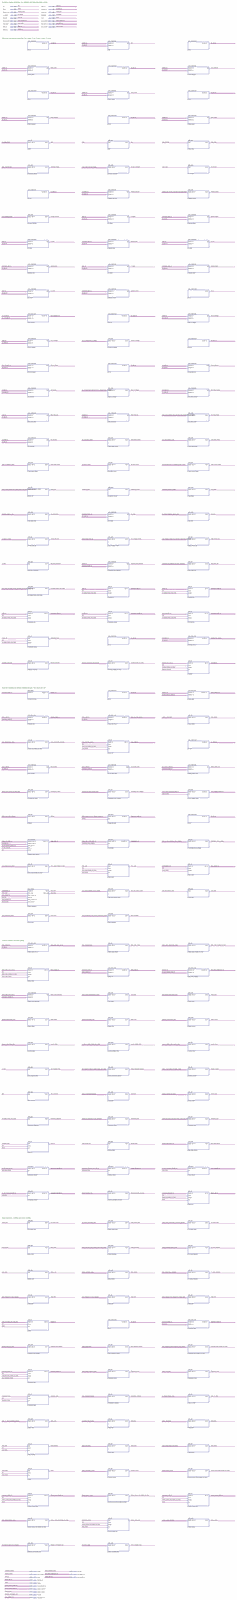
[diagram p0: schematic sheet, whole]
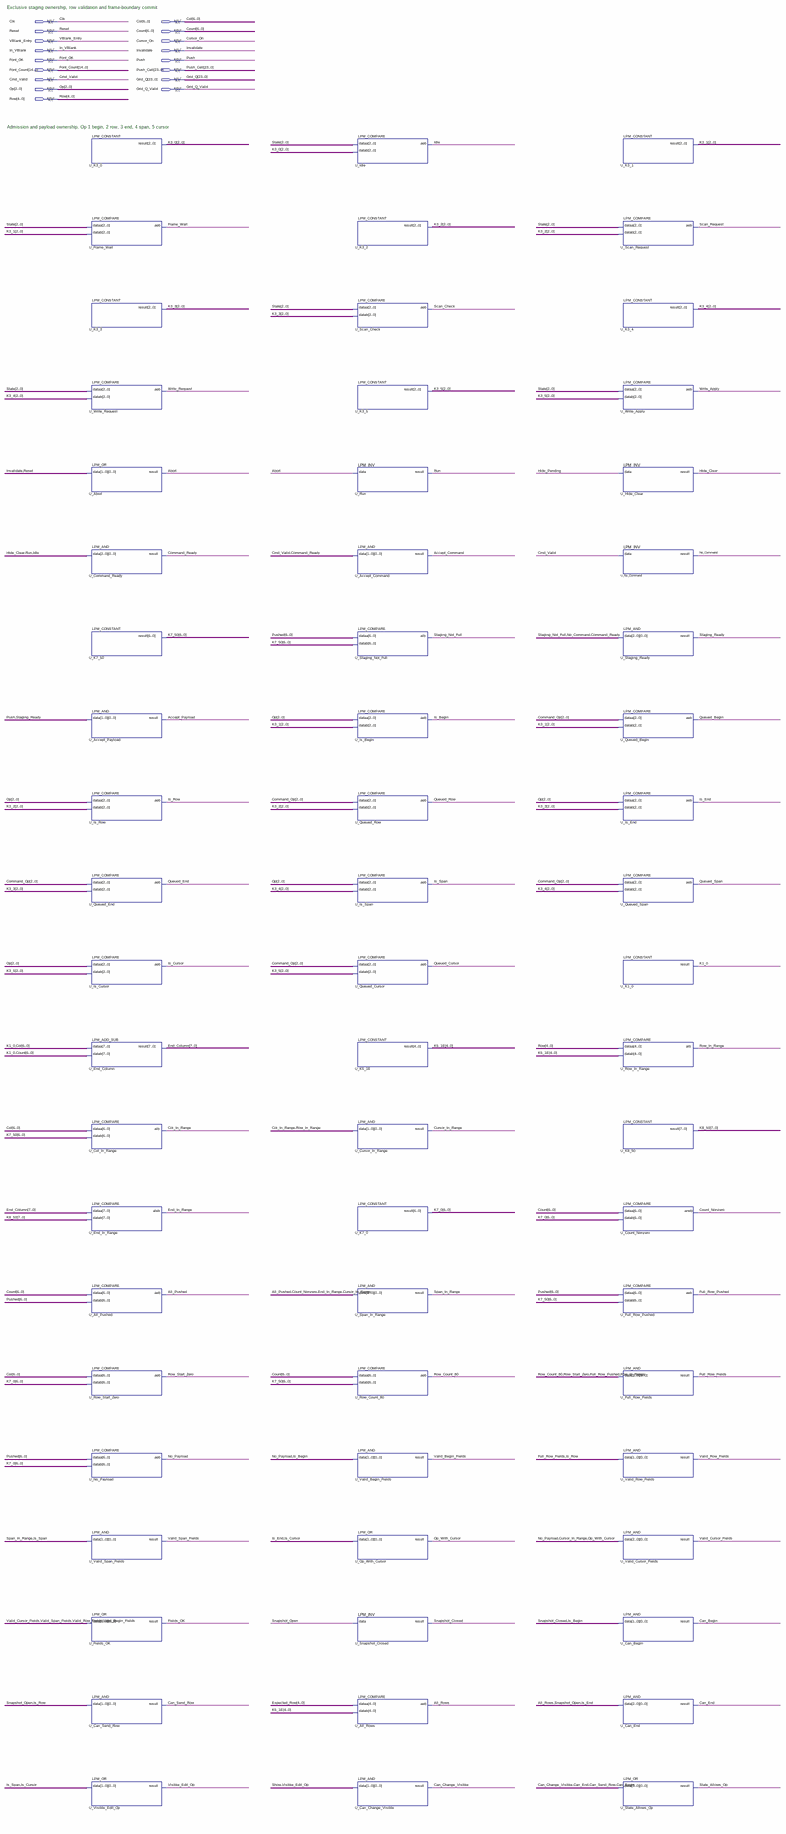
[diagram p1: schematic sheet, upper part]
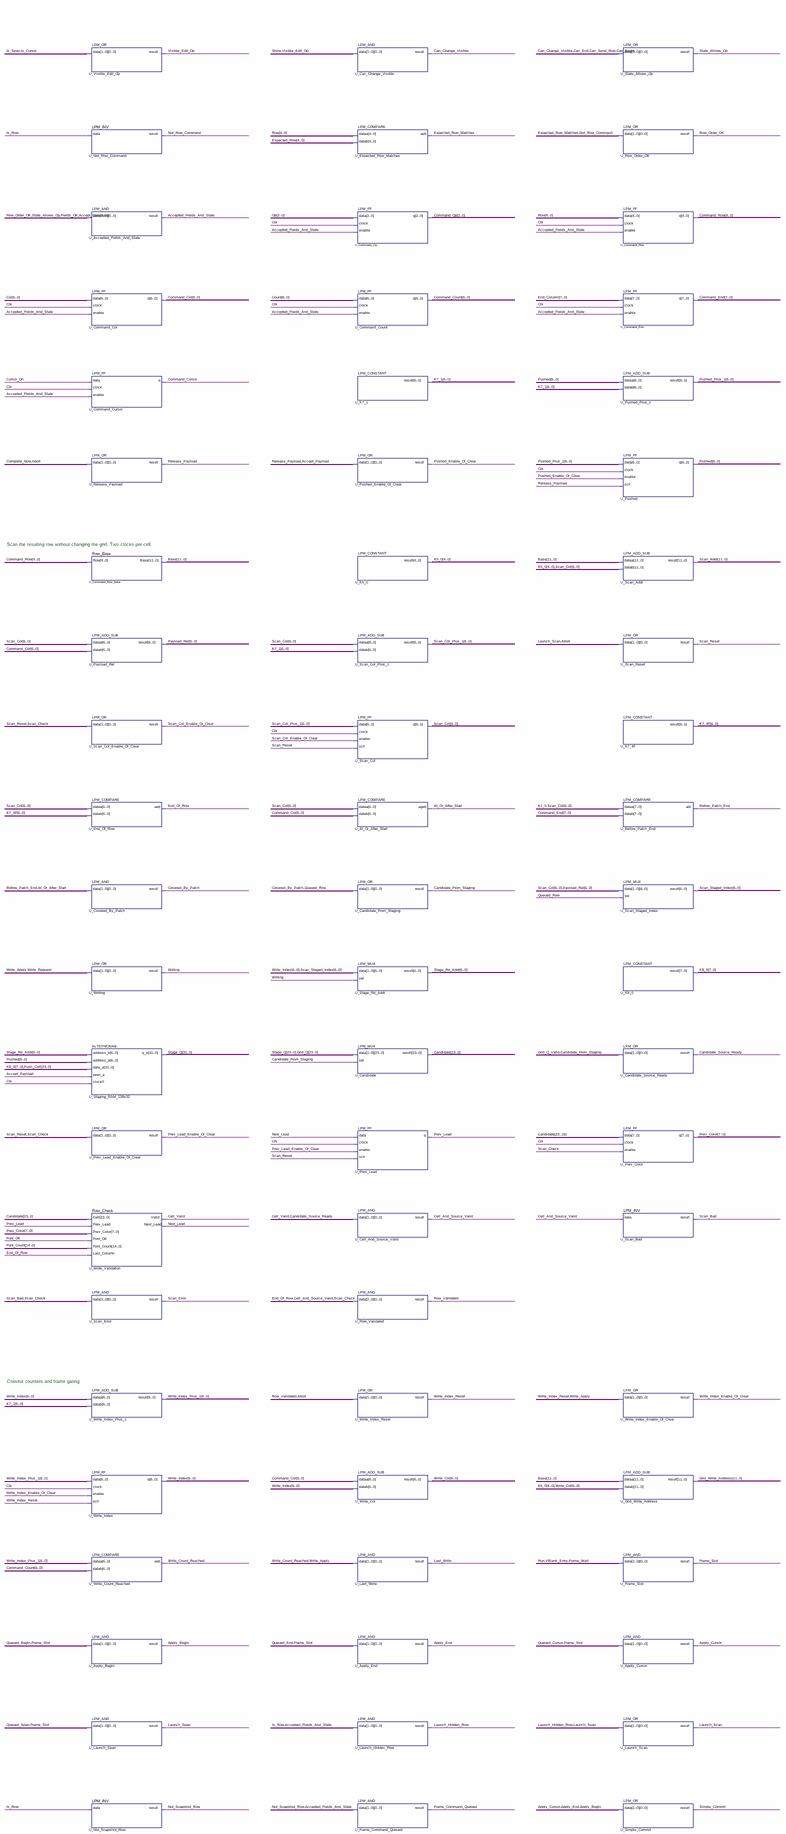
[diagram p2: schematic sheet, middle part]
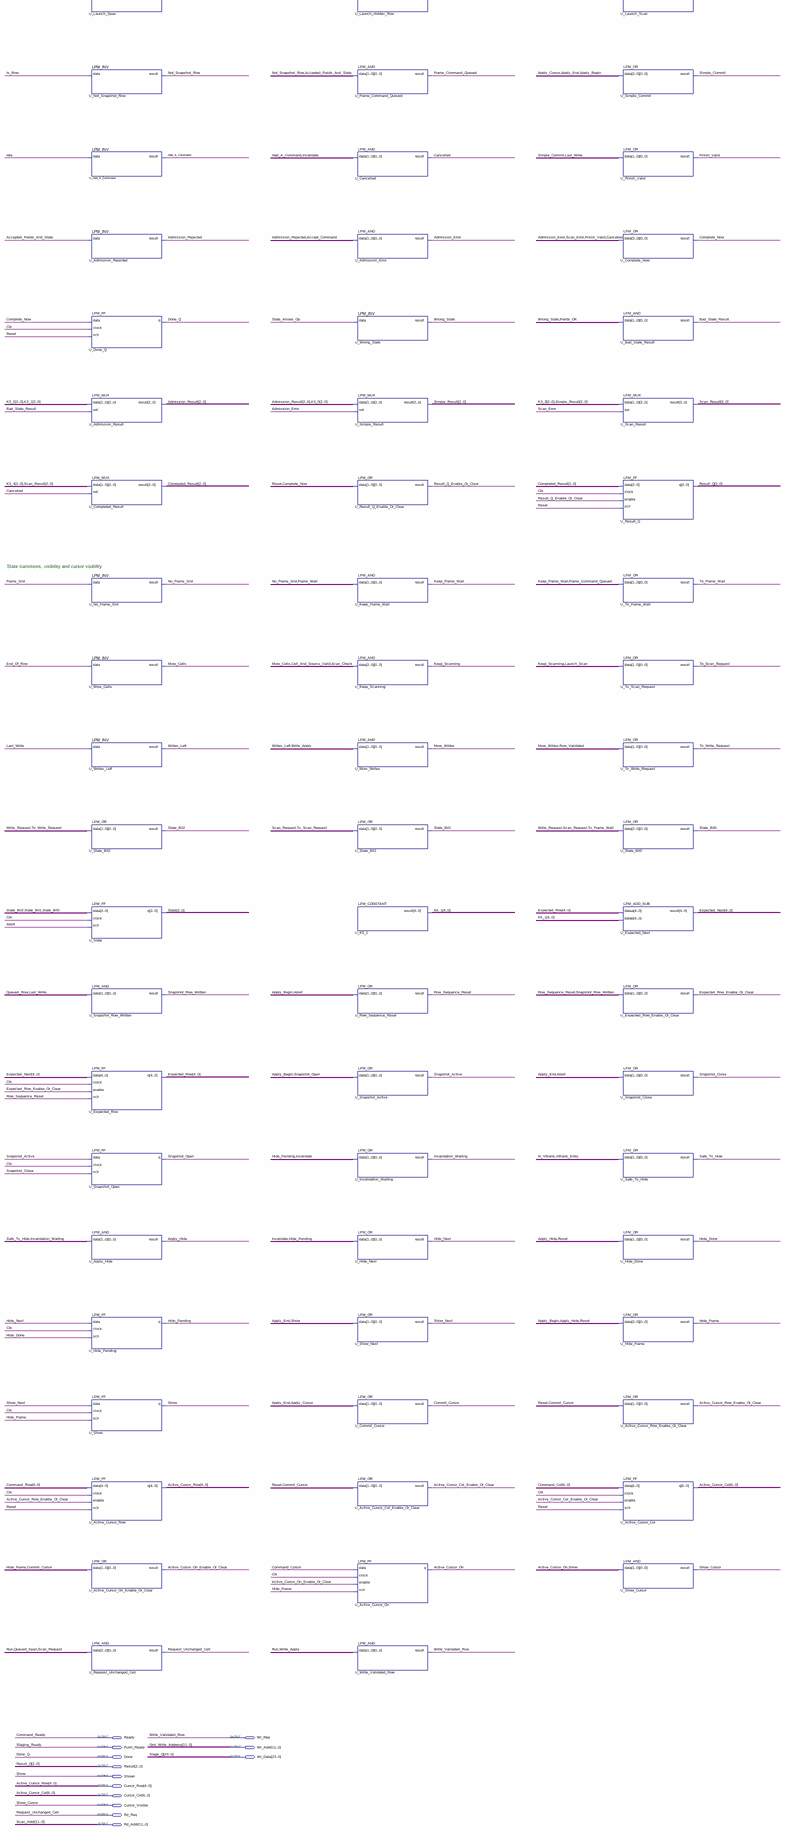
[diagram p3: schematic sheet, lower part]
// Quartus schematic Screen_Commit.bdf as structural Verilog: 181 symbols, 30 pins
module Screen_Commit (
  input  Clk,
  input  [6:0] Col,
  input  Reset,
  input  [6:0] Count,
  input  VBlank_Entry,
  input  Cursor_On,
  input  In_VBlank,
  input  Invalidate,
  input  Font_OK,
  input  Push,
  input  [14:0] Font_Count,
  input  [23:0] Push_Cell,
  input  Cmd_Valid,
  input  [23:0] Grid_Q,
  input  [2:0] Op,
  input  Grid_Q_Valid,
  input  [4:0] Row,
  output Ready,
  output Wr_Req,
  output Push_Ready,
  output [11:0] Wr_Addr,
  output Done,
  output [23:0] Wr_Data,
  output [2:0] Result,
  output Shown,
  output [4:0] Cursor_Row,
  output [6:0] Cursor_Col,
  output Cursor_Visible,
  output Rd_Req,
  output [11:0] Rd_Addr
);

  wire Abort, Accept_Command, Accept_Payload, Accepted_Fields_And_State, Active_Cursor_Col_Enable_Or_Clear,
       Active_Cursor_On, Active_Cursor_On_Enable_Or_Clear, Active_Cursor_Row_Enable_Or_Clear,
       Admission_Error, Admission_Rejected, All_Pushed, All_Rows, Apply_Begin, Apply_Cursor, Apply_End,
       Apply_Hide, At_Or_After_Start, Bad_State_Result, Before_Patch_End, Can_Begin, Can_Change_Visible,
       Can_End, Can_Send_Row, Cancelled, Candidate_From_Staging, Candidate_Source_Ready,
       Cell_And_Source_Valid, Cell_Valid, Col_In_Range, Command_Cursor, Commit_Cursor, Complete_Now,
       Count_Nonzero, Covered_By_Patch, Cursor_In_Range, End_In_Range, End_Of_Row,
       Expected_Row_Enable_Or_Clear, Expected_Row_Matches, Fields_OK, Finish_Valid, Frame_Command_Queued,
       Frame_Slot, Frame_Wait, Full_Row_Fields, Full_Row_Pushed, Had_A_Command, Hide_Clear, Hide_Done,
       Hide_Frame, Hide_Next, Hide_Pending, Idle, Invalidation_Waiting, Is_Begin, Is_Cursor, Is_End, Is_Row,
       Is_Span, K1_0, Keep_Frame_Wait, Keep_Scanning, Last_Write, Launch_Hidden_Row, Launch_Scan,
       Launch_Span, More_Cells, More_Writes, New_Lead, No_Command, No_Frame_Slot, No_Payload,
       Not_Row_Command, Not_Snapshot_Row, Op_With_Cursor, Prev_Lead, Prev_Lead_Enable_Or_Clear,
       Pushed_Enable_Or_Clear, Queued_Begin, Queued_Cursor, Queued_End, Queued_Row, Queued_Span,
       Release_Payload, Result_Q_Enable_Or_Clear, Row_Count_80, Row_In_Range, Row_Order_OK,
       Row_Sequence_Reset, Row_Start_Zero, Row_Validated, Run, Safe_To_Hide, Scan_Bad, Scan_Check,
       Scan_Col_Enable_Or_Clear, Scan_Error, Scan_Request, Scan_Reset, Show_Next, Simple_Commit,
       Snapshot_Active, Snapshot_Close, Snapshot_Closed, Snapshot_Open, Snapshot_Row_Written, Span_In_Range,
       Staging_Not_Full, State_Allows_Op, State_Bit0, State_Bit1, State_Bit2, To_Frame_Wait, To_Scan_Request,
       To_Write_Request, Valid_Begin_Fields, Valid_Cursor_Fields, Valid_Row_Fields, Valid_Span_Fields,
       Visible_Edit_Op, Write_Apply, Write_Count_Reached, Write_Index_Enable_Or_Clear, Write_Index_Reset,
       Write_Request, Writes_Left, Writing, Wrong_State;
  wire [2:0] Admission_Result, Command_Op, Completed_Result, K3_0, K3_1, K3_2, K3_3, K3_4, K3_5, Scan_Result,
       Simple_Result, State;
  wire [4:0] Command_Row, Expected_Next, Expected_Row, K5_0, K5_1, K5_1E;
  wire [6:0] Command_Col, Command_Count, K7_0, K7_1, K7_4F, K7_50, Payload_Rel, Pushed, Pushed_Plus_1,
       Scan_Col, Scan_Col_Plus_1, Scan_Staged_Index, Stage_Rd_Addr, Write_Col, Write_Index,
       Write_Index_Plus_1;
  wire [7:0] Command_End, End_Column, K8_0, K8_50, Prev_Color;
  wire [11:0] Base;
  wire [23:0] Candidate;
  wire [31:24] Stage_Q;

  LPM_CONSTANT #(.LPM_WIDTH(3), .LPM_CVALUE(0)) U_K3_0 (.result(K3_0));
  LPM_COMPARE #(.LPM_WIDTH(3), .LPM_REPRESENTATION("UNSIGNED")) U_Frame_Wait (
    .dataa(State), .datab(K3_1), .aeb(Frame_Wait));
  LPM_CONSTANT #(.LPM_WIDTH(3), .LPM_CVALUE(3)) U_K3_3 (.result(K3_3));
  LPM_COMPARE #(.LPM_WIDTH(3), .LPM_REPRESENTATION("UNSIGNED")) U_Write_Request (
    .dataa(State), .datab(K3_4), .aeb(Write_Request));
  LPM_OR #(.LPM_WIDTH(1), .LPM_SIZE(2)) U_Abort (.data({Invalidate, Reset}), .result(Abort));
  LPM_AND #(.LPM_WIDTH(1), .LPM_SIZE(3)) U_Command_Ready (.data({Hide_Clear, Run, Idle}), .result(Ready));
  LPM_CONSTANT #(.LPM_WIDTH(7), .LPM_CVALUE(80)) U_K7_50 (.result(K7_50));
  LPM_AND #(.LPM_WIDTH(1), .LPM_SIZE(2)) U_Accept_Payload (.data({Push, Push_Ready}), .result(Accept_Payload));
  LPM_COMPARE #(.LPM_WIDTH(3), .LPM_REPRESENTATION("UNSIGNED")) U_Is_Row (.dataa(Op), .datab(K3_2), .aeb(Is_Row));
  LPM_COMPARE #(.LPM_WIDTH(3), .LPM_REPRESENTATION("UNSIGNED")) U_Queued_End (
    .dataa(Command_Op), .datab(K3_3), .aeb(Queued_End));
  LPM_COMPARE #(.LPM_WIDTH(3), .LPM_REPRESENTATION("UNSIGNED")) U_Is_Cursor (.dataa(Op), .datab(K3_5), .aeb(Is_Cursor));
  LPM_ADD_SUB #(.LPM_WIDTH(8), .LPM_DIRECTION("ADD"), .LPM_REPRESENTATION("UNSIGNED")) U_End_Column (
    .dataa({K1_0, Col}), .datab({K1_0, Count}), .result(End_Column));
  LPM_COMPARE #(.LPM_WIDTH(7), .LPM_REPRESENTATION("UNSIGNED")) U_Col_In_Range (
    .dataa(Col), .datab(K7_50), .alb(Col_In_Range));
  LPM_COMPARE #(.LPM_WIDTH(8), .LPM_REPRESENTATION("UNSIGNED")) U_End_In_Range (
    .dataa(End_Column), .datab(K8_50), .aleb(End_In_Range));
  LPM_COMPARE #(.LPM_WIDTH(7), .LPM_REPRESENTATION("UNSIGNED")) U_All_Pushed (
    .dataa(Count), .datab(Pushed), .aeb(All_Pushed));
  LPM_COMPARE #(.LPM_WIDTH(7), .LPM_REPRESENTATION("UNSIGNED")) U_Row_Start_Zero (
    .dataa(Col), .datab(K7_0), .aeb(Row_Start_Zero));
  LPM_COMPARE #(.LPM_WIDTH(7), .LPM_REPRESENTATION("UNSIGNED")) U_No_Payload (
    .dataa(Pushed), .datab(K7_0), .aeb(No_Payload));
  LPM_AND #(.LPM_WIDTH(1), .LPM_SIZE(2)) U_Valid_Span_Fields (
    .data({Span_In_Range, Is_Span}), .result(Valid_Span_Fields));
  LPM_OR #(.LPM_WIDTH(1), .LPM_SIZE(4)) U_Fields_OK (
    .data({Valid_Cursor_Fields, Valid_Span_Fields, Valid_Row_Fields, Valid_Begin_Fields}), .result(Fields_OK));
  LPM_AND #(.LPM_WIDTH(1), .LPM_SIZE(2)) U_Can_Send_Row (.data({Snapshot_Open, Is_Row}), .result(Can_Send_Row));
  LPM_OR #(.LPM_WIDTH(1), .LPM_SIZE(2)) U_Visible_Edit_Op (.data({Is_Span, Is_Cursor}), .result(Visible_Edit_Op));
  LPM_INV #(.LPM_WIDTH(1)) U_Not_Row_Command (.data(Is_Row), .result(Not_Row_Command));
  LPM_AND #(.LPM_WIDTH(1), .LPM_SIZE(4)) U_Accepted_Fields_And_State (
    .data({Row_Order_OK, State_Allows_Op, Fields_OK, Accept_Command}), .result(Accepted_Fields_And_State));
  LPM_FF #(.LPM_WIDTH(7), .LPM_FFTYPE("DFF")) U_Command_Col (
    .data(Col), .clock(Clk), .enable(Accepted_Fields_And_State), .q(Command_Col));
  LPM_FF #(.LPM_WIDTH(1), .LPM_FFTYPE("DFF")) U_Command_Cursor (
    .data(Cursor_On), .clock(Clk), .enable(Accepted_Fields_And_State), .q(Command_Cursor));
  LPM_OR #(.LPM_WIDTH(1), .LPM_SIZE(2)) U_Release_Payload (.data({Complete_Now, Abort}), .result(Release_Payload));
  Row_Base U_Command_Row_Base (.Row(Command_Row), .Base(Base));
  LPM_ADD_SUB #(.LPM_WIDTH(7), .LPM_DIRECTION("SUB"), .LPM_REPRESENTATION("UNSIGNED")) U_Payload_Rel (
    .dataa(Scan_Col), .datab(Command_Col), .result(Payload_Rel));
  LPM_OR #(.LPM_WIDTH(1), .LPM_SIZE(2)) U_Scan_Col_Enable_Or_Clear (
    .data({Scan_Reset, Scan_Check}), .result(Scan_Col_Enable_Or_Clear));
  LPM_COMPARE #(.LPM_WIDTH(7), .LPM_REPRESENTATION("UNSIGNED")) U_End_Of_Row (
    .dataa(Scan_Col), .datab(K7_4F), .aeb(End_Of_Row));
  LPM_AND #(.LPM_WIDTH(1), .LPM_SIZE(2)) U_Covered_By_Patch (
    .data({Before_Patch_End, At_Or_After_Start}), .result(Covered_By_Patch));
  LPM_OR #(.LPM_WIDTH(1), .LPM_SIZE(2)) U_Writing (.data({Write_Apply, Write_Request}), .result(Writing));
  ALTSYNCRAM #(.OPERATION_MODE("DUAL_PORT"), .RAM_BLOCK_TYPE("M4K"), .WIDTH_A(32), .WIDTH_B(32), .WIDTHAD_A(7), .WIDTHAD_B(7), .NUMWORDS_A(128), .NUMWORDS_B(128), .ADDRESS_REG_B("CLOCK0"), .OUTDATA_REG_B("UNREGISTERED"), .READ_DURING_WRITE_MODE_MIXED_PORTS("DONT_CARE")) U_Staging_RAM_128x32 (
    .address_b(Stage_Rd_Addr), .address_a(Pushed), .data_a({K8_0, Push_Cell}), .wren_a(Accept_Payload),
    .clock0(Clk), .q_b({Stage_Q, Wr_Data}));
  LPM_OR #(.LPM_WIDTH(1), .LPM_SIZE(2)) U_Prev_Lead_Enable_Or_Clear (
    .data({Scan_Reset, Scan_Check}), .result(Prev_Lead_Enable_Or_Clear));
  Row_Check U_Wide_Validation (
    .Cell(Candidate), .Prev_Lead(Prev_Lead), .Prev_Color(Prev_Color), .Font_OK(Font_OK),
    .Font_Count(Font_Count), .Last_Column(End_Of_Row), .Valid(Cell_Valid), .Next_Lead(New_Lead));
  LPM_AND #(.LPM_WIDTH(1), .LPM_SIZE(2)) U_Scan_Error (.data({Scan_Bad, Scan_Check}), .result(Scan_Error));
  LPM_ADD_SUB #(.LPM_WIDTH(7), .LPM_DIRECTION("ADD"), .LPM_REPRESENTATION("UNSIGNED")) U_Write_Index_Plus_1 (
    .dataa(Write_Index), .datab(K7_1), .result(Write_Index_Plus_1));
  LPM_FF #(.LPM_WIDTH(7), .LPM_FFTYPE("DFF")) U_Write_Index (
    .data(Write_Index_Plus_1), .clock(Clk), .enable(Write_Index_Enable_Or_Clear), .sclr(Write_Index_Reset),
    .q(Write_Index));
  LPM_COMPARE #(.LPM_WIDTH(7), .LPM_REPRESENTATION("UNSIGNED")) U_Write_Count_Reached (
    .dataa(Write_Index_Plus_1), .datab(Command_Count), .aeb(Write_Count_Reached));
  LPM_AND #(.LPM_WIDTH(1), .LPM_SIZE(2)) U_Apply_Begin (.data({Queued_Begin, Frame_Slot}), .result(Apply_Begin));
  LPM_AND #(.LPM_WIDTH(1), .LPM_SIZE(2)) U_Launch_Span (.data({Queued_Span, Frame_Slot}), .result(Launch_Span));
  LPM_INV #(.LPM_WIDTH(1)) U_Not_Snapshot_Row (.data(Is_Row), .result(Not_Snapshot_Row));
  LPM_INV #(.LPM_WIDTH(1)) U_Had_A_Command (.data(Idle), .result(Had_A_Command));
  LPM_INV #(.LPM_WIDTH(1)) U_Admission_Rejected (.data(Accepted_Fields_And_State), .result(Admission_Rejected));
  LPM_FF #(.LPM_WIDTH(1), .LPM_FFTYPE("DFF")) U_Done_Q (.data(Complete_Now), .clock(Clk), .sclr(Reset), .q(Done));
  LPM_MUX #(.LPM_WIDTH(3), .LPM_SIZE(2), .LPM_WIDTHS(1)) U_Admission_Result (
    .data({K3_2, K3_1}), .sel(Bad_State_Result), .result(Admission_Result));
  LPM_MUX #(.LPM_WIDTH(3), .LPM_SIZE(2), .LPM_WIDTHS(1)) U_Completed_Result (
    .data({K3_4, Scan_Result}), .sel(Cancelled), .result(Completed_Result));
  LPM_INV #(.LPM_WIDTH(1)) U_No_Frame_Slot (.data(Frame_Slot), .result(No_Frame_Slot));
  LPM_INV #(.LPM_WIDTH(1)) U_More_Cells (.data(End_Of_Row), .result(More_Cells));
  LPM_INV #(.LPM_WIDTH(1)) U_Writes_Left (.data(Last_Write), .result(Writes_Left));
  LPM_OR #(.LPM_WIDTH(1), .LPM_SIZE(2)) U_State_Bit2 (.data({Write_Request, To_Write_Request}), .result(State_Bit2));
  LPM_FF #(.LPM_WIDTH(3), .LPM_FFTYPE("DFF")) U_State (
    .data({State_Bit2, State_Bit1, State_Bit0}), .clock(Clk), .sclr(Abort), .q(State));
  LPM_AND #(.LPM_WIDTH(1), .LPM_SIZE(2)) U_Snapshot_Row_Written (
    .data({Queued_Row, Last_Write}), .result(Snapshot_Row_Written));
  LPM_FF #(.LPM_WIDTH(5), .LPM_FFTYPE("DFF")) U_Expected_Row (
    .data(Expected_Next), .clock(Clk), .enable(Expected_Row_Enable_Or_Clear), .sclr(Row_Sequence_Reset),
    .q(Expected_Row));
  LPM_FF #(.LPM_WIDTH(1), .LPM_FFTYPE("DFF")) U_Snapshot_Open (
    .data(Snapshot_Active), .clock(Clk), .sclr(Snapshot_Close), .q(Snapshot_Open));
  LPM_AND #(.LPM_WIDTH(1), .LPM_SIZE(2)) U_Apply_Hide (
    .data({Safe_To_Hide, Invalidation_Waiting}), .result(Apply_Hide));
  LPM_FF #(.LPM_WIDTH(1), .LPM_FFTYPE("DFF")) U_Hide_Pending (
    .data(Hide_Next), .clock(Clk), .sclr(Hide_Done), .q(Hide_Pending));
  LPM_FF #(.LPM_WIDTH(1), .LPM_FFTYPE("DFF")) U_Show (.data(Show_Next), .clock(Clk), .sclr(Hide_Frame), .q(Shown));
  LPM_FF #(.LPM_WIDTH(5), .LPM_FFTYPE("DFF")) U_Active_Cursor_Row (
    .data(Command_Row), .clock(Clk), .enable(Active_Cursor_Row_Enable_Or_Clear), .sclr(Reset), .q(Cursor_Row));
  LPM_OR #(.LPM_WIDTH(1), .LPM_SIZE(2)) U_Active_Cursor_On_Enable_Or_Clear (
    .data({Hide_Frame, Commit_Cursor}), .result(Active_Cursor_On_Enable_Or_Clear));
  LPM_AND #(.LPM_WIDTH(1), .LPM_SIZE(3)) U_Request_Unchanged_Cell (
    .data({Run, Queued_Span, Scan_Request}), .result(Rd_Req));
  LPM_COMPARE #(.LPM_WIDTH(3), .LPM_REPRESENTATION("UNSIGNED")) U_Idle (.dataa(State), .datab(K3_0), .aeb(Idle));
  LPM_CONSTANT #(.LPM_WIDTH(3), .LPM_CVALUE(2)) U_K3_2 (.result(K3_2));
  LPM_COMPARE #(.LPM_WIDTH(3), .LPM_REPRESENTATION("UNSIGNED")) U_Scan_Check (
    .dataa(State), .datab(K3_3), .aeb(Scan_Check));
  LPM_CONSTANT #(.LPM_WIDTH(3), .LPM_CVALUE(5)) U_K3_5 (.result(K3_5));
  LPM_INV #(.LPM_WIDTH(1)) U_Run (.data(Abort), .result(Run));
  LPM_AND #(.LPM_WIDTH(1), .LPM_SIZE(2)) U_Accept_Command (.data({Cmd_Valid, Ready}), .result(Accept_Command));
  LPM_COMPARE #(.LPM_WIDTH(7), .LPM_REPRESENTATION("UNSIGNED")) U_Staging_Not_Full (
    .dataa(Pushed), .datab(K7_50), .alb(Staging_Not_Full));
  LPM_COMPARE #(.LPM_WIDTH(3), .LPM_REPRESENTATION("UNSIGNED")) U_Is_Begin (.dataa(Op), .datab(K3_1), .aeb(Is_Begin));
  LPM_COMPARE #(.LPM_WIDTH(3), .LPM_REPRESENTATION("UNSIGNED")) U_Queued_Row (
    .dataa(Command_Op), .datab(K3_2), .aeb(Queued_Row));
  LPM_COMPARE #(.LPM_WIDTH(3), .LPM_REPRESENTATION("UNSIGNED")) U_Is_Span (.dataa(Op), .datab(K3_4), .aeb(Is_Span));
  LPM_COMPARE #(.LPM_WIDTH(3), .LPM_REPRESENTATION("UNSIGNED")) U_Queued_Cursor (
    .dataa(Command_Op), .datab(K3_5), .aeb(Queued_Cursor));
  LPM_CONSTANT #(.LPM_WIDTH(5), .LPM_CVALUE(30)) U_K5_1E (.result(K5_1E));
  LPM_AND #(.LPM_WIDTH(1), .LPM_SIZE(2)) U_Cursor_In_Range (
    .data({Col_In_Range, Row_In_Range}), .result(Cursor_In_Range));
  LPM_CONSTANT #(.LPM_WIDTH(7), .LPM_CVALUE(0)) U_K7_0 (.result(K7_0));
  LPM_AND #(.LPM_WIDTH(1), .LPM_SIZE(4)) U_Span_In_Range (
    .data({All_Pushed, Count_Nonzero, End_In_Range, Cursor_In_Range}), .result(Span_In_Range));
  LPM_COMPARE #(.LPM_WIDTH(7), .LPM_REPRESENTATION("UNSIGNED")) U_Row_Count_80 (
    .dataa(Count), .datab(K7_50), .aeb(Row_Count_80));
  LPM_AND #(.LPM_WIDTH(1), .LPM_SIZE(2)) U_Valid_Begin_Fields (
    .data({No_Payload, Is_Begin}), .result(Valid_Begin_Fields));
  LPM_OR #(.LPM_WIDTH(1), .LPM_SIZE(2)) U_Op_With_Cursor (.data({Is_End, Is_Cursor}), .result(Op_With_Cursor));
  LPM_INV #(.LPM_WIDTH(1)) U_Snapshot_Closed (.data(Snapshot_Open), .result(Snapshot_Closed));
  LPM_COMPARE #(.LPM_WIDTH(5), .LPM_REPRESENTATION("UNSIGNED")) U_All_Rows (
    .dataa(Expected_Row), .datab(K5_1E), .aeb(All_Rows));
  LPM_AND #(.LPM_WIDTH(1), .LPM_SIZE(2)) U_Can_Change_Visible (
    .data({Shown, Visible_Edit_Op}), .result(Can_Change_Visible));
  LPM_COMPARE #(.LPM_WIDTH(5), .LPM_REPRESENTATION("UNSIGNED")) U_Expected_Row_Matches (
    .dataa(Row), .datab(Expected_Row), .aeb(Expected_Row_Matches));
  LPM_FF #(.LPM_WIDTH(3), .LPM_FFTYPE("DFF")) U_Command_Op (
    .data(Op), .clock(Clk), .enable(Accepted_Fields_And_State), .q(Command_Op));
  LPM_FF #(.LPM_WIDTH(7), .LPM_FFTYPE("DFF")) U_Command_Count (
    .data(Count), .clock(Clk), .enable(Accepted_Fields_And_State), .q(Command_Count));
  LPM_CONSTANT #(.LPM_WIDTH(7), .LPM_CVALUE(1)) U_K7_1 (.result(K7_1));
  LPM_OR #(.LPM_WIDTH(1), .LPM_SIZE(2)) U_Pushed_Enable_Or_Clear (
    .data({Release_Payload, Accept_Payload}), .result(Pushed_Enable_Or_Clear));
  LPM_CONSTANT #(.LPM_WIDTH(5), .LPM_CVALUE(0)) U_K5_0 (.result(K5_0));
  LPM_ADD_SUB #(.LPM_WIDTH(7), .LPM_DIRECTION("ADD"), .LPM_REPRESENTATION("UNSIGNED")) U_Scan_Col_Plus_1 (
    .dataa(Scan_Col), .datab(K7_1), .result(Scan_Col_Plus_1));
  LPM_FF #(.LPM_WIDTH(7), .LPM_FFTYPE("DFF")) U_Scan_Col (
    .data(Scan_Col_Plus_1), .clock(Clk), .enable(Scan_Col_Enable_Or_Clear), .sclr(Scan_Reset), .q(Scan_Col));
  LPM_COMPARE #(.LPM_WIDTH(7), .LPM_REPRESENTATION("UNSIGNED")) U_At_Or_After_Start (
    .dataa(Scan_Col), .datab(Command_Col), .ageb(At_Or_After_Start));
  LPM_OR #(.LPM_WIDTH(1), .LPM_SIZE(2)) U_Candidate_From_Staging (
    .data({Covered_By_Patch, Queued_Row}), .result(Candidate_From_Staging));
  LPM_MUX #(.LPM_WIDTH(7), .LPM_SIZE(2), .LPM_WIDTHS(1)) U_Stage_Rd_Addr (
    .data({Write_Index, Scan_Staged_Index}), .sel(Writing), .result(Stage_Rd_Addr));
  LPM_MUX #(.LPM_WIDTH(24), .LPM_SIZE(2), .LPM_WIDTHS(1)) U_Candidate (
    .data({Wr_Data, Grid_Q}), .sel(Candidate_From_Staging), .result(Candidate));
  LPM_FF #(.LPM_WIDTH(1), .LPM_FFTYPE("DFF")) U_Prev_Lead (
    .data(New_Lead), .clock(Clk), .enable(Prev_Lead_Enable_Or_Clear), .sclr(Scan_Reset), .q(Prev_Lead));
  LPM_AND #(.LPM_WIDTH(1), .LPM_SIZE(2)) U_Cell_And_Source_Valid (
    .data({Cell_Valid, Candidate_Source_Ready}), .result(Cell_And_Source_Valid));
  LPM_AND #(.LPM_WIDTH(1), .LPM_SIZE(3)) U_Row_Validated (
    .data({End_Of_Row, Cell_And_Source_Valid, Scan_Check}), .result(Row_Validated));
  LPM_OR #(.LPM_WIDTH(1), .LPM_SIZE(2)) U_Write_Index_Reset (.data({Row_Validated, Abort}), .result(Write_Index_Reset));
  LPM_ADD_SUB #(.LPM_WIDTH(7), .LPM_DIRECTION("ADD"), .LPM_REPRESENTATION("UNSIGNED")) U_Write_Col (
    .dataa(Command_Col), .datab(Write_Index), .result(Write_Col));
  LPM_AND #(.LPM_WIDTH(1), .LPM_SIZE(2)) U_Last_Write (.data({Write_Count_Reached, Write_Apply}), .result(Last_Write));
  LPM_AND #(.LPM_WIDTH(1), .LPM_SIZE(2)) U_Apply_End (.data({Queued_End, Frame_Slot}), .result(Apply_End));
  LPM_AND #(.LPM_WIDTH(1), .LPM_SIZE(2)) U_Launch_Hidden_Row (
    .data({Is_Row, Accepted_Fields_And_State}), .result(Launch_Hidden_Row));
  LPM_AND #(.LPM_WIDTH(1), .LPM_SIZE(2)) U_Frame_Command_Queued (
    .data({Not_Snapshot_Row, Accepted_Fields_And_State}), .result(Frame_Command_Queued));
  LPM_AND #(.LPM_WIDTH(1), .LPM_SIZE(2)) U_Cancelled (.data({Had_A_Command, Invalidate}), .result(Cancelled));
  LPM_AND #(.LPM_WIDTH(1), .LPM_SIZE(2)) U_Admission_Error (
    .data({Admission_Rejected, Accept_Command}), .result(Admission_Error));
  LPM_INV #(.LPM_WIDTH(1)) U_Wrong_State (.data(State_Allows_Op), .result(Wrong_State));
  LPM_MUX #(.LPM_WIDTH(3), .LPM_SIZE(2), .LPM_WIDTHS(1)) U_Simple_Result (
    .data({Admission_Result, K3_0}), .sel(Admission_Error), .result(Simple_Result));
  LPM_OR #(.LPM_WIDTH(1), .LPM_SIZE(2)) U_Result_Q_Enable_Or_Clear (
    .data({Reset, Complete_Now}), .result(Result_Q_Enable_Or_Clear));
  LPM_AND #(.LPM_WIDTH(1), .LPM_SIZE(2)) U_Keep_Frame_Wait (
    .data({No_Frame_Slot, Frame_Wait}), .result(Keep_Frame_Wait));
  LPM_AND #(.LPM_WIDTH(1), .LPM_SIZE(3)) U_Keep_Scanning (
    .data({More_Cells, Cell_And_Source_Valid, Scan_Check}), .result(Keep_Scanning));
  LPM_AND #(.LPM_WIDTH(1), .LPM_SIZE(2)) U_More_Writes (.data({Writes_Left, Write_Apply}), .result(More_Writes));
  LPM_OR #(.LPM_WIDTH(1), .LPM_SIZE(2)) U_State_Bit1 (.data({Scan_Request, To_Scan_Request}), .result(State_Bit1));
  LPM_CONSTANT #(.LPM_WIDTH(5), .LPM_CVALUE(1)) U_K5_1 (.result(K5_1));
  LPM_OR #(.LPM_WIDTH(1), .LPM_SIZE(2)) U_Row_Sequence_Reset (.data({Apply_Begin, Abort}), .result(Row_Sequence_Reset));
  LPM_OR #(.LPM_WIDTH(1), .LPM_SIZE(2)) U_Snapshot_Active (
    .data({Apply_Begin, Snapshot_Open}), .result(Snapshot_Active));
  LPM_OR #(.LPM_WIDTH(1), .LPM_SIZE(2)) U_Invalidation_Waiting (
    .data({Hide_Pending, Invalidate}), .result(Invalidation_Waiting));
  LPM_OR #(.LPM_WIDTH(1), .LPM_SIZE(2)) U_Hide_Next (.data({Invalidate, Hide_Pending}), .result(Hide_Next));
  LPM_OR #(.LPM_WIDTH(1), .LPM_SIZE(2)) U_Show_Next (.data({Apply_End, Shown}), .result(Show_Next));
  LPM_OR #(.LPM_WIDTH(1), .LPM_SIZE(2)) U_Commit_Cursor (.data({Apply_End, Apply_Cursor}), .result(Commit_Cursor));
  LPM_OR #(.LPM_WIDTH(1), .LPM_SIZE(2)) U_Active_Cursor_Col_Enable_Or_Clear (
    .data({Reset, Commit_Cursor}), .result(Active_Cursor_Col_Enable_Or_Clear));
  LPM_FF #(.LPM_WIDTH(1), .LPM_FFTYPE("DFF")) U_Active_Cursor_On (
    .data(Command_Cursor), .clock(Clk), .enable(Active_Cursor_On_Enable_Or_Clear), .sclr(Hide_Frame),
    .q(Active_Cursor_On));
  LPM_AND #(.LPM_WIDTH(1), .LPM_SIZE(2)) U_Write_Validated_Row (.data({Run, Write_Apply}), .result(Wr_Req));
  LPM_CONSTANT #(.LPM_WIDTH(3), .LPM_CVALUE(1)) U_K3_1 (.result(K3_1));
  LPM_COMPARE #(.LPM_WIDTH(3), .LPM_REPRESENTATION("UNSIGNED")) U_Scan_Request (
    .dataa(State), .datab(K3_2), .aeb(Scan_Request));
  LPM_CONSTANT #(.LPM_WIDTH(3), .LPM_CVALUE(4)) U_K3_4 (.result(K3_4));
  LPM_COMPARE #(.LPM_WIDTH(3), .LPM_REPRESENTATION("UNSIGNED")) U_Write_Apply (
    .dataa(State), .datab(K3_5), .aeb(Write_Apply));
  LPM_INV #(.LPM_WIDTH(1)) U_Hide_Clear (.data(Hide_Pending), .result(Hide_Clear));
  LPM_INV #(.LPM_WIDTH(1)) U_No_Command (.data(Cmd_Valid), .result(No_Command));
  LPM_AND #(.LPM_WIDTH(1), .LPM_SIZE(3)) U_Staging_Ready (
    .data({Staging_Not_Full, No_Command, Ready}), .result(Push_Ready));
  LPM_COMPARE #(.LPM_WIDTH(3), .LPM_REPRESENTATION("UNSIGNED")) U_Queued_Begin (
    .dataa(Command_Op), .datab(K3_1), .aeb(Queued_Begin));
  LPM_COMPARE #(.LPM_WIDTH(3), .LPM_REPRESENTATION("UNSIGNED")) U_Is_End (.dataa(Op), .datab(K3_3), .aeb(Is_End));
  LPM_COMPARE #(.LPM_WIDTH(3), .LPM_REPRESENTATION("UNSIGNED")) U_Queued_Span (
    .dataa(Command_Op), .datab(K3_4), .aeb(Queued_Span));
  LPM_CONSTANT #(.LPM_WIDTH(1), .LPM_CVALUE(0)) U_K1_0 (.result(K1_0));
  LPM_COMPARE #(.LPM_WIDTH(5), .LPM_REPRESENTATION("UNSIGNED")) U_Row_In_Range (
    .dataa(Row), .datab(K5_1E), .alb(Row_In_Range));
  LPM_CONSTANT #(.LPM_WIDTH(8), .LPM_CVALUE(80)) U_K8_50 (.result(K8_50));
  LPM_COMPARE #(.LPM_WIDTH(7), .LPM_REPRESENTATION("UNSIGNED")) U_Count_Nonzero (
    .dataa(Count), .datab(K7_0), .aneb(Count_Nonzero));
  LPM_COMPARE #(.LPM_WIDTH(7), .LPM_REPRESENTATION("UNSIGNED")) U_Full_Row_Pushed (
    .dataa(Pushed), .datab(K7_50), .aeb(Full_Row_Pushed));
  LPM_AND #(.LPM_WIDTH(1), .LPM_SIZE(4)) U_Full_Row_Fields (
    .data({Row_Count_80, Row_Start_Zero, Full_Row_Pushed, Row_In_Range}), .result(Full_Row_Fields));
  LPM_AND #(.LPM_WIDTH(1), .LPM_SIZE(2)) U_Valid_Row_Fields (
    .data({Full_Row_Fields, Is_Row}), .result(Valid_Row_Fields));
  LPM_AND #(.LPM_WIDTH(1), .LPM_SIZE(3)) U_Valid_Cursor_Fields (
    .data({No_Payload, Cursor_In_Range, Op_With_Cursor}), .result(Valid_Cursor_Fields));
  LPM_AND #(.LPM_WIDTH(1), .LPM_SIZE(2)) U_Can_Begin (.data({Snapshot_Closed, Is_Begin}), .result(Can_Begin));
  LPM_AND #(.LPM_WIDTH(1), .LPM_SIZE(3)) U_Can_End (.data({All_Rows, Snapshot_Open, Is_End}), .result(Can_End));
  LPM_OR #(.LPM_WIDTH(1), .LPM_SIZE(4)) U_State_Allows_Op (
    .data({Can_Change_Visible, Can_End, Can_Send_Row, Can_Begin}), .result(State_Allows_Op));
  LPM_OR #(.LPM_WIDTH(1), .LPM_SIZE(2)) U_Row_Order_OK (
    .data({Expected_Row_Matches, Not_Row_Command}), .result(Row_Order_OK));
  LPM_FF #(.LPM_WIDTH(5), .LPM_FFTYPE("DFF")) U_Command_Row (
    .data(Row), .clock(Clk), .enable(Accepted_Fields_And_State), .q(Command_Row));
  LPM_FF #(.LPM_WIDTH(8), .LPM_FFTYPE("DFF")) U_Command_End (
    .data(End_Column), .clock(Clk), .enable(Accepted_Fields_And_State), .q(Command_End));
  LPM_ADD_SUB #(.LPM_WIDTH(7), .LPM_DIRECTION("ADD"), .LPM_REPRESENTATION("UNSIGNED")) U_Pushed_Plus_1 (
    .dataa(Pushed), .datab(K7_1), .result(Pushed_Plus_1));
  LPM_FF #(.LPM_WIDTH(7), .LPM_FFTYPE("DFF")) U_Pushed (
    .data(Pushed_Plus_1), .clock(Clk), .enable(Pushed_Enable_Or_Clear), .sclr(Release_Payload), .q(Pushed));
  LPM_ADD_SUB #(.LPM_WIDTH(12), .LPM_DIRECTION("ADD"), .LPM_REPRESENTATION("UNSIGNED")) U_Scan_Addr (
    .dataa(Base), .datab({K5_0, Scan_Col}), .result(Rd_Addr));
  LPM_OR #(.LPM_WIDTH(1), .LPM_SIZE(2)) U_Scan_Reset (.data({Launch_Scan, Abort}), .result(Scan_Reset));
  LPM_CONSTANT #(.LPM_WIDTH(7), .LPM_CVALUE(79)) U_K7_4F (.result(K7_4F));
  LPM_COMPARE #(.LPM_WIDTH(8), .LPM_REPRESENTATION("UNSIGNED")) U_Before_Patch_End (
    .dataa({K1_0, Scan_Col}), .datab(Command_End), .alb(Before_Patch_End));
  LPM_MUX #(.LPM_WIDTH(7), .LPM_SIZE(2), .LPM_WIDTHS(1)) U_Scan_Staged_Index (
    .data({Scan_Col, Payload_Rel}), .sel(Queued_Row), .result(Scan_Staged_Index));
  LPM_CONSTANT #(.LPM_WIDTH(8), .LPM_CVALUE(0)) U_K8_0 (.result(K8_0));
  LPM_OR #(.LPM_WIDTH(1), .LPM_SIZE(2)) U_Candidate_Source_Ready (
    .data({Grid_Q_Valid, Candidate_From_Staging}), .result(Candidate_Source_Ready));
  LPM_FF #(.LPM_WIDTH(8), .LPM_FFTYPE("DFF")) U_Prev_Color (
    .data(Candidate[23:16]), .clock(Clk), .enable(Scan_Check), .q(Prev_Color));
  LPM_INV #(.LPM_WIDTH(1)) U_Scan_Bad (.data(Cell_And_Source_Valid), .result(Scan_Bad));
  LPM_OR #(.LPM_WIDTH(1), .LPM_SIZE(2)) U_Write_Index_Enable_Or_Clear (
    .data({Write_Index_Reset, Write_Apply}), .result(Write_Index_Enable_Or_Clear));
  LPM_ADD_SUB #(.LPM_WIDTH(12), .LPM_DIRECTION("ADD"), .LPM_REPRESENTATION("UNSIGNED")) U_Grid_Write_Address (
    .dataa(Base), .datab({K5_0, Write_Col}), .result(Wr_Addr));
  LPM_AND #(.LPM_WIDTH(1), .LPM_SIZE(3)) U_Frame_Slot (.data({Run, VBlank_Entry, Frame_Wait}), .result(Frame_Slot));
  LPM_AND #(.LPM_WIDTH(1), .LPM_SIZE(2)) U_Apply_Cursor (.data({Queued_Cursor, Frame_Slot}), .result(Apply_Cursor));
  LPM_OR #(.LPM_WIDTH(1), .LPM_SIZE(2)) U_Launch_Scan (.data({Launch_Hidden_Row, Launch_Span}), .result(Launch_Scan));
  LPM_OR #(.LPM_WIDTH(1), .LPM_SIZE(3)) U_Simple_Commit (
    .data({Apply_Cursor, Apply_End, Apply_Begin}), .result(Simple_Commit));
  LPM_OR #(.LPM_WIDTH(1), .LPM_SIZE(2)) U_Finish_Valid (.data({Simple_Commit, Last_Write}), .result(Finish_Valid));
  LPM_OR #(.LPM_WIDTH(1), .LPM_SIZE(4)) U_Complete_Now (
    .data({Admission_Error, Scan_Error, Finish_Valid, Cancelled}), .result(Complete_Now));
  LPM_AND #(.LPM_WIDTH(1), .LPM_SIZE(2)) U_Bad_State_Result (
    .data({Wrong_State, Fields_OK}), .result(Bad_State_Result));
  LPM_MUX #(.LPM_WIDTH(3), .LPM_SIZE(2), .LPM_WIDTHS(1)) U_Scan_Result (
    .data({K3_3, Simple_Result}), .sel(Scan_Error), .result(Scan_Result));
  LPM_FF #(.LPM_WIDTH(3), .LPM_FFTYPE("DFF")) U_Result_Q (
    .data(Completed_Result), .clock(Clk), .enable(Result_Q_Enable_Or_Clear), .sclr(Reset), .q(Result));
  LPM_OR #(.LPM_WIDTH(1), .LPM_SIZE(2)) U_To_Frame_Wait (
    .data({Keep_Frame_Wait, Frame_Command_Queued}), .result(To_Frame_Wait));
  LPM_OR #(.LPM_WIDTH(1), .LPM_SIZE(2)) U_To_Scan_Request (
    .data({Keep_Scanning, Launch_Scan}), .result(To_Scan_Request));
  LPM_OR #(.LPM_WIDTH(1), .LPM_SIZE(2)) U_To_Write_Request (
    .data({More_Writes, Row_Validated}), .result(To_Write_Request));
  LPM_OR #(.LPM_WIDTH(1), .LPM_SIZE(3)) U_State_Bit0 (
    .data({Write_Request, Scan_Request, To_Frame_Wait}), .result(State_Bit0));
  LPM_ADD_SUB #(.LPM_WIDTH(5), .LPM_DIRECTION("ADD"), .LPM_REPRESENTATION("UNSIGNED")) U_Expected_Next (
    .dataa(Expected_Row), .datab(K5_1), .result(Expected_Next));
  LPM_OR #(.LPM_WIDTH(1), .LPM_SIZE(2)) U_Expected_Row_Enable_Or_Clear (
    .data({Row_Sequence_Reset, Snapshot_Row_Written}), .result(Expected_Row_Enable_Or_Clear));
  LPM_OR #(.LPM_WIDTH(1), .LPM_SIZE(2)) U_Snapshot_Close (.data({Apply_End, Abort}), .result(Snapshot_Close));
  LPM_OR #(.LPM_WIDTH(1), .LPM_SIZE(2)) U_Safe_To_Hide (.data({In_VBlank, VBlank_Entry}), .result(Safe_To_Hide));
  LPM_OR #(.LPM_WIDTH(1), .LPM_SIZE(2)) U_Hide_Done (.data({Apply_Hide, Reset}), .result(Hide_Done));
  LPM_OR #(.LPM_WIDTH(1), .LPM_SIZE(3)) U_Hide_Frame (.data({Apply_Begin, Apply_Hide, Reset}), .result(Hide_Frame));
  LPM_OR #(.LPM_WIDTH(1), .LPM_SIZE(2)) U_Active_Cursor_Row_Enable_Or_Clear (
    .data({Reset, Commit_Cursor}), .result(Active_Cursor_Row_Enable_Or_Clear));
  LPM_FF #(.LPM_WIDTH(7), .LPM_FFTYPE("DFF")) U_Active_Cursor_Col (
    .data(Command_Col), .clock(Clk), .enable(Active_Cursor_Col_Enable_Or_Clear), .sclr(Reset), .q(Cursor_Col));
  LPM_AND #(.LPM_WIDTH(1), .LPM_SIZE(2)) U_Show_Cursor (.data({Active_Cursor_On, Shown}), .result(Cursor_Visible));

  // Other names for the same wires on the sheet: Active_Cursor_Col[6:0] = Cursor_Col;
  //   Active_Cursor_Row[4:0] = Cursor_Row; Command_Ready = Ready; Done_Q = Done; Grid_Write_Address[11:0] = Wr_Addr;
  //   Request_Unchanged_Cell = Rd_Req; Result_Q[2:0] = Result; Scan_Addr[11:0] = Rd_Addr; Show = Shown;
  //   Show_Cursor = Cursor_Visible; Stage_Q[23:0] = Wr_Data; Staging_Ready = Push_Ready; Write_Validated_Row = Wr_Req

  // Notes on the sheet:
  //   Exclusive staging ownership, row validation and frame-boundary commit
  //   Admission and payload ownership. Op 1 begin, 2 row, 3 end, 4 span, 5 cursor
  //   Scan the resulting row without changing the grid. Two clocks per cell
  //   Commit counters and frame gating
  //   State transitions, visibility and cursor visibility
endmodule
